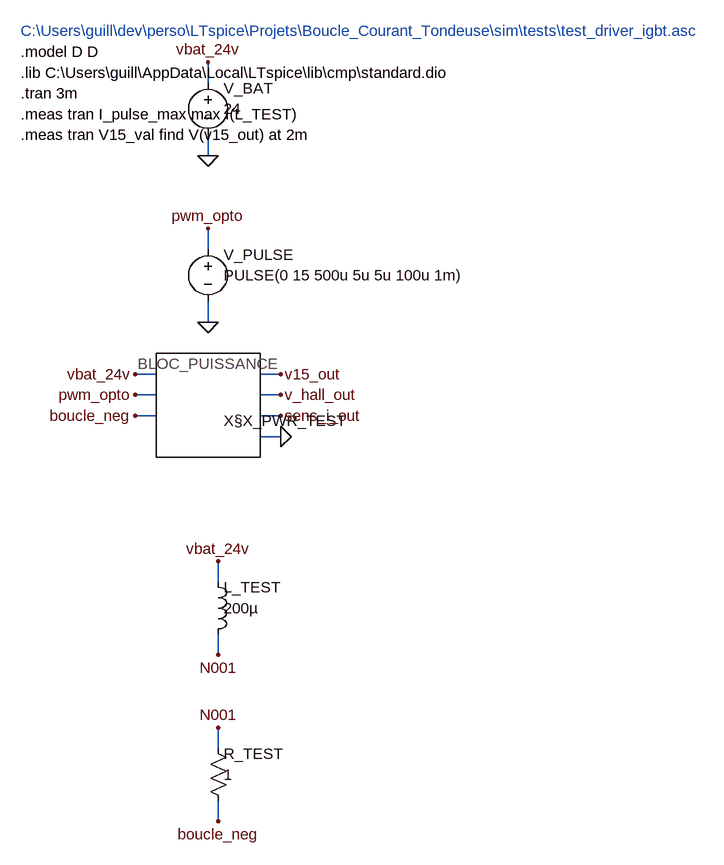
[diagram p0: schematic test_driver_igbt.asc]
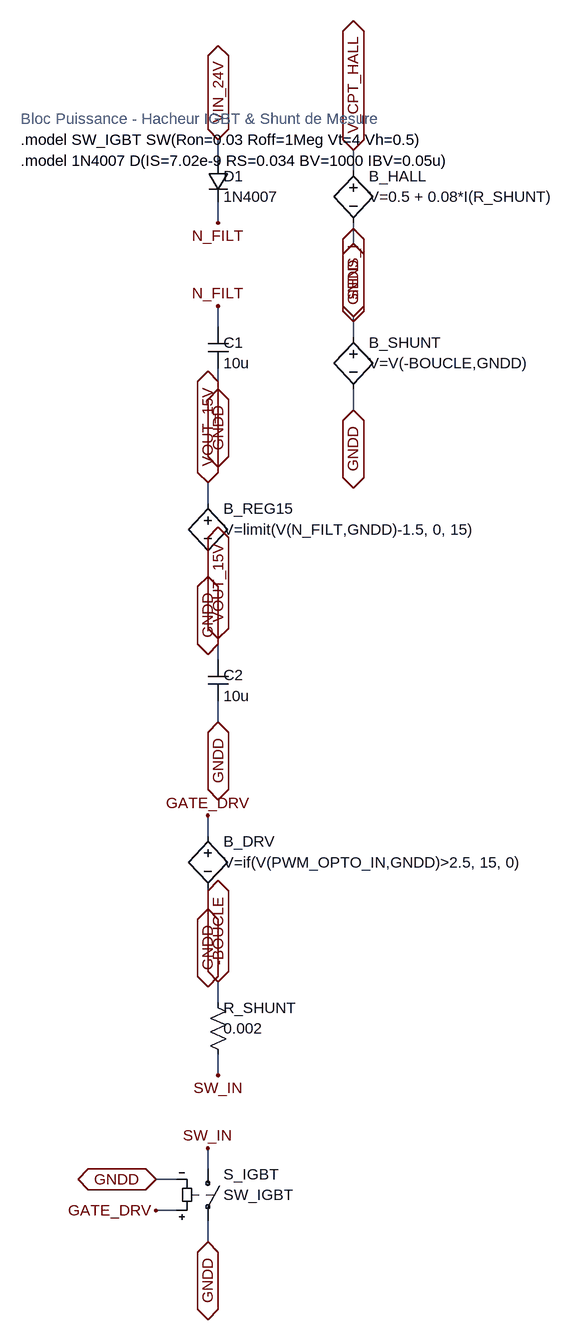
[diagram p1: sub-circuit bloc_puissance.asc]
test_driver_igbt.asc, the LTspice schematic file:
Version 4
SHEET 1 3200 2400
TEXT 32 32 Left 2 ;C:\Users\guill\dev\perso\LTspice\Projets\Boucle_Courant_Tondeuse\sim\tests\test_driver_igbt.asc
TEXT 32 64 Left 2 !.model D D
TEXT 32 96 Left 2 !.lib C:\Users\guill\AppData\Local\LTspice\lib\cmp\standard.dio
TEXT 32 128 Left 2 !.tran 3m
TEXT 32 160 Left 2 !.meas tran I_pulse_max max I(L_TEST)
TEXT 32 192 Left 2 !.meas tran V15_val find V(v15_out) at 2m
SYMBOL voltage 320 96 R0
WINDOW 0 24 24 Left 2
WINDOW 3 24 56 Left 2
SYMATTR InstName V_BAT
SYMATTR Value 24
WIRE 320 112 320 80
FLAG 320 80 vbat_24v
WIRE 320 192 320 224
FLAG 320 224 0
SYMBOL voltage 320 352 R0
WINDOW 0 24 24 Left 2
WINDOW 3 24 56 Left 2
SYMATTR InstName V_PULSE
SYMATTR Value PULSE(0 15 500u 5u 5u 100u 1m)
WIRE 320 368 320 336
FLAG 320 336 pwm_opto
WIRE 320 448 320 480
FLAG 320 480 0
SYMBOL ..\blocks\bloc_puissance 320 608 R0
WINDOW 0 24 24 Left 2
WINDOW 3 24 56 Left 2
SYMATTR InstName X§X_PWR_TEST
WIRE 240 560 208 560
FLAG 208 560 vbat_24v
WIRE 240 592 208 592
FLAG 208 592 pwm_opto
WIRE 240 624 208 624
FLAG 208 624 boucle_neg
WIRE 400 560 432 560
FLAG 432 560 v15_out
WIRE 400 592 432 592
FLAG 432 592 v_hall_out
WIRE 400 624 432 624
FLAG 432 624 sens_i_out
WIRE 400 656 432 656
FLAG 432 656 0
SYMBOL ind 320 864 R0
WINDOW 0 24 24 Left 2
WINDOW 3 24 56 Left 2
SYMATTR InstName L_TEST
SYMATTR Value 200µ
WIRE 336 880 336 848
FLAG 336 848 vbat_24v
WIRE 336 960 336 992
FLAG 336 992 N001
SYMBOL res 320 1120 R0
WINDOW 0 24 24 Left 2
WINDOW 3 24 56 Left 2
SYMATTR InstName R_TEST
SYMATTR Value 1
WIRE 336 1136 336 1104
FLAG 336 1104 N001
WIRE 336 1216 336 1248
FLAG 336 1248 boucle_neg

bloc_puissance.asc, the sub-circuit schematic file:
Version 4
SHEET 1 3200 2400
TEXT 32 32 Left 2 ;Bloc Puissance - Hacheur IGBT & Shunt de Mesure
TEXT 32 64 Left 2 !.model SW_IGBT SW(Ron=0.03 Roff=1Meg Vt=4 Vh=0.5)
TEXT 32 96 Left 2 !.model 1N4007 D(IS=7.02e-9 RS=0.034 BV=1000 IBV=0.05u)
SYMBOL diode 320 96 R0
WINDOW 0 24 24 Left 2
WINDOW 3 24 56 Left 2
SYMATTR InstName D1
SYMATTR Value 1N4007
WIRE 336 96 336 64
FLAG 336 64 VIN_24V
IOPIN 336 64 BiDir
WIRE 336 160 336 192
FLAG 336 192 N_FILT
SYMBOL cap 320 352 R0
WINDOW 0 24 24 Left 2
WINDOW 3 24 56 Left 2
SYMATTR InstName C1
SYMATTR Value 10u
WIRE 336 352 336 320
FLAG 336 320 N_FILT
WIRE 336 416 336 448
FLAG 336 448 GNDD
IOPIN 336 448 BiDir
SYMBOL bv 320 608 R0
WINDOW 0 24 24 Left 2
WINDOW 3 24 56 Left 2
SYMATTR InstName B_REG15
SYMATTR Value V=limit(V(N_FILT,GNDD)-1.5, 0, 15)
WIRE 320 624 320 592
FLAG 320 592 VOUT_15V
IOPIN 320 592 BiDir
WIRE 320 704 320 736
FLAG 320 736 GNDD
IOPIN 320 736 BiDir
SYMBOL cap 320 864 R0
WINDOW 0 24 24 Left 2
WINDOW 3 24 56 Left 2
SYMATTR InstName C2
SYMATTR Value 10u
WIRE 336 864 336 832
FLAG 336 832 VOUT_15V
IOPIN 336 832 BiDir
WIRE 336 928 336 960
FLAG 336 960 GNDD
IOPIN 336 960 BiDir
SYMBOL bv 320 1120 R0
WINDOW 0 24 24 Left 2
WINDOW 3 24 56 Left 2
SYMATTR InstName B_DRV
SYMATTR Value V=if(V(PWM_OPTO_IN,GNDD)>2.5, 15, 0)
WIRE 320 1136 320 1104
FLAG 320 1104 GATE_DRV
WIRE 320 1216 320 1248
FLAG 320 1248 GNDD
IOPIN 320 1248 BiDir
SYMBOL res 320 1376 R0
WINDOW 0 24 24 Left 2
WINDOW 3 24 56 Left 2
SYMATTR InstName R_SHUNT
SYMATTR Value 0.002
WIRE 336 1392 336 1360
FLAG 336 1360 -BOUCLE
IOPIN 336 1360 BiDir
WIRE 336 1472 336 1504
FLAG 336 1504 SW_IN
SYMBOL sw 320 1632 R0
WINDOW 0 24 24 Left 2
WINDOW 3 24 56 Left 2
SYMATTR InstName S_IGBT
SYMATTR Value SW_IGBT
WIRE 320 1648 320 1616
FLAG 320 1616 SW_IN
WIRE 320 1728 320 1760
FLAG 320 1760 GNDD
IOPIN 320 1760 BiDir
WIRE 272 1712 240 1712
FLAG 240 1712 GATE_DRV
WIRE 272 1664 240 1664
FLAG 240 1664 GNDD
IOPIN 240 1664 BiDir
SYMBOL bv 544 96 R0
WINDOW 0 24 24 Left 2
WINDOW 3 24 56 Left 2
SYMATTR InstName B_HALL
SYMATTR Value V=0.5 + 0.08*I(R_SHUNT)
WIRE 544 112 544 80
FLAG 544 80 V_CPT_HALL
IOPIN 544 80 BiDir
WIRE 544 192 544 224
FLAG 544 224 GNDD
IOPIN 544 224 BiDir
SYMBOL bv 544 352 R0
WINDOW 0 24 24 Left 2
WINDOW 3 24 56 Left 2
SYMATTR InstName B_SHUNT
SYMATTR Value V=V(-BOUCLE,GNDD)
WIRE 544 368 544 336
FLAG 544 336 SENS_I
IOPIN 544 336 BiDir
WIRE 544 448 544 480
FLAG 544 480 GNDD
IOPIN 544 480 BiDir

The netlist it stands for:
* test_driver_igbt.asc
V_BAT vbat_24v 0 24
V_PULSE pwm_opto 0 PULSE(0 15 500u 5u 5u 100u 1m)
XX§X_PWR_TEST vbat_24v pwm_opto boucle_neg v15_out v_hall_out sens_i_out 0 bloc_puissance
L_TEST vbat_24v N001 200µ
R_TEST N001 boucle_neg 1

* block symbol definitions
.subckt bloc_puissance VIN_24V PWM_OPTO_IN -BOUCLE VOUT_15V V_CPT_HALL SENS_I GNDD
D1 VIN_24V N_FILT 1N4007
C1 N_FILT GNDD 10u
B_REG15 VOUT_15V GNDD V=limit(V(N_FILT,GNDD)-1.5, 0, 15)
C2 VOUT_15V GNDD 10u
B_DRV GATE_DRV GNDD V=if(V(PWM_OPTO_IN,GNDD)>2.5, 15, 0)
R_SHUNT -BOUCLE SW_IN 0.002
S_IGBT SW_IN GNDD GATE_DRV GNDD SW_IGBT
B_HALL V_CPT_HALL GNDD V=0.5 + 0.08*I(R_SHUNT)
B_SHUNT SENS_I GNDD V=V(-BOUCLE,GNDD)
* Bloc Puissance - Hacheur IGBT & Shunt de Mesure
.model SW_IGBT SW(Ron=0.03 Roff=1Meg Vt=4 Vh=0.5)
.model 1N4007 D(IS=7.02e-9 RS=0.034 BV=1000 IBV=0.05u)
.ends bloc_puissance

.model D D
.lib standard.dio
* C:\Users\guill\dev\perso\LTspice\Projets\Boucle_Courant_Tondeuse\sim\tests\test_driver_igbt.asc
.model D D
.lib C:\Users\guill\AppData\Local\LTspice\lib\cmp\standard.dio
.tran 3m
.meas tran I_pulse_max max I(L_TEST)
.meas tran V15_val find V(v15_out) at 2m
.backanno
.end